# Altium project Kiki's Farm.PrjPcb
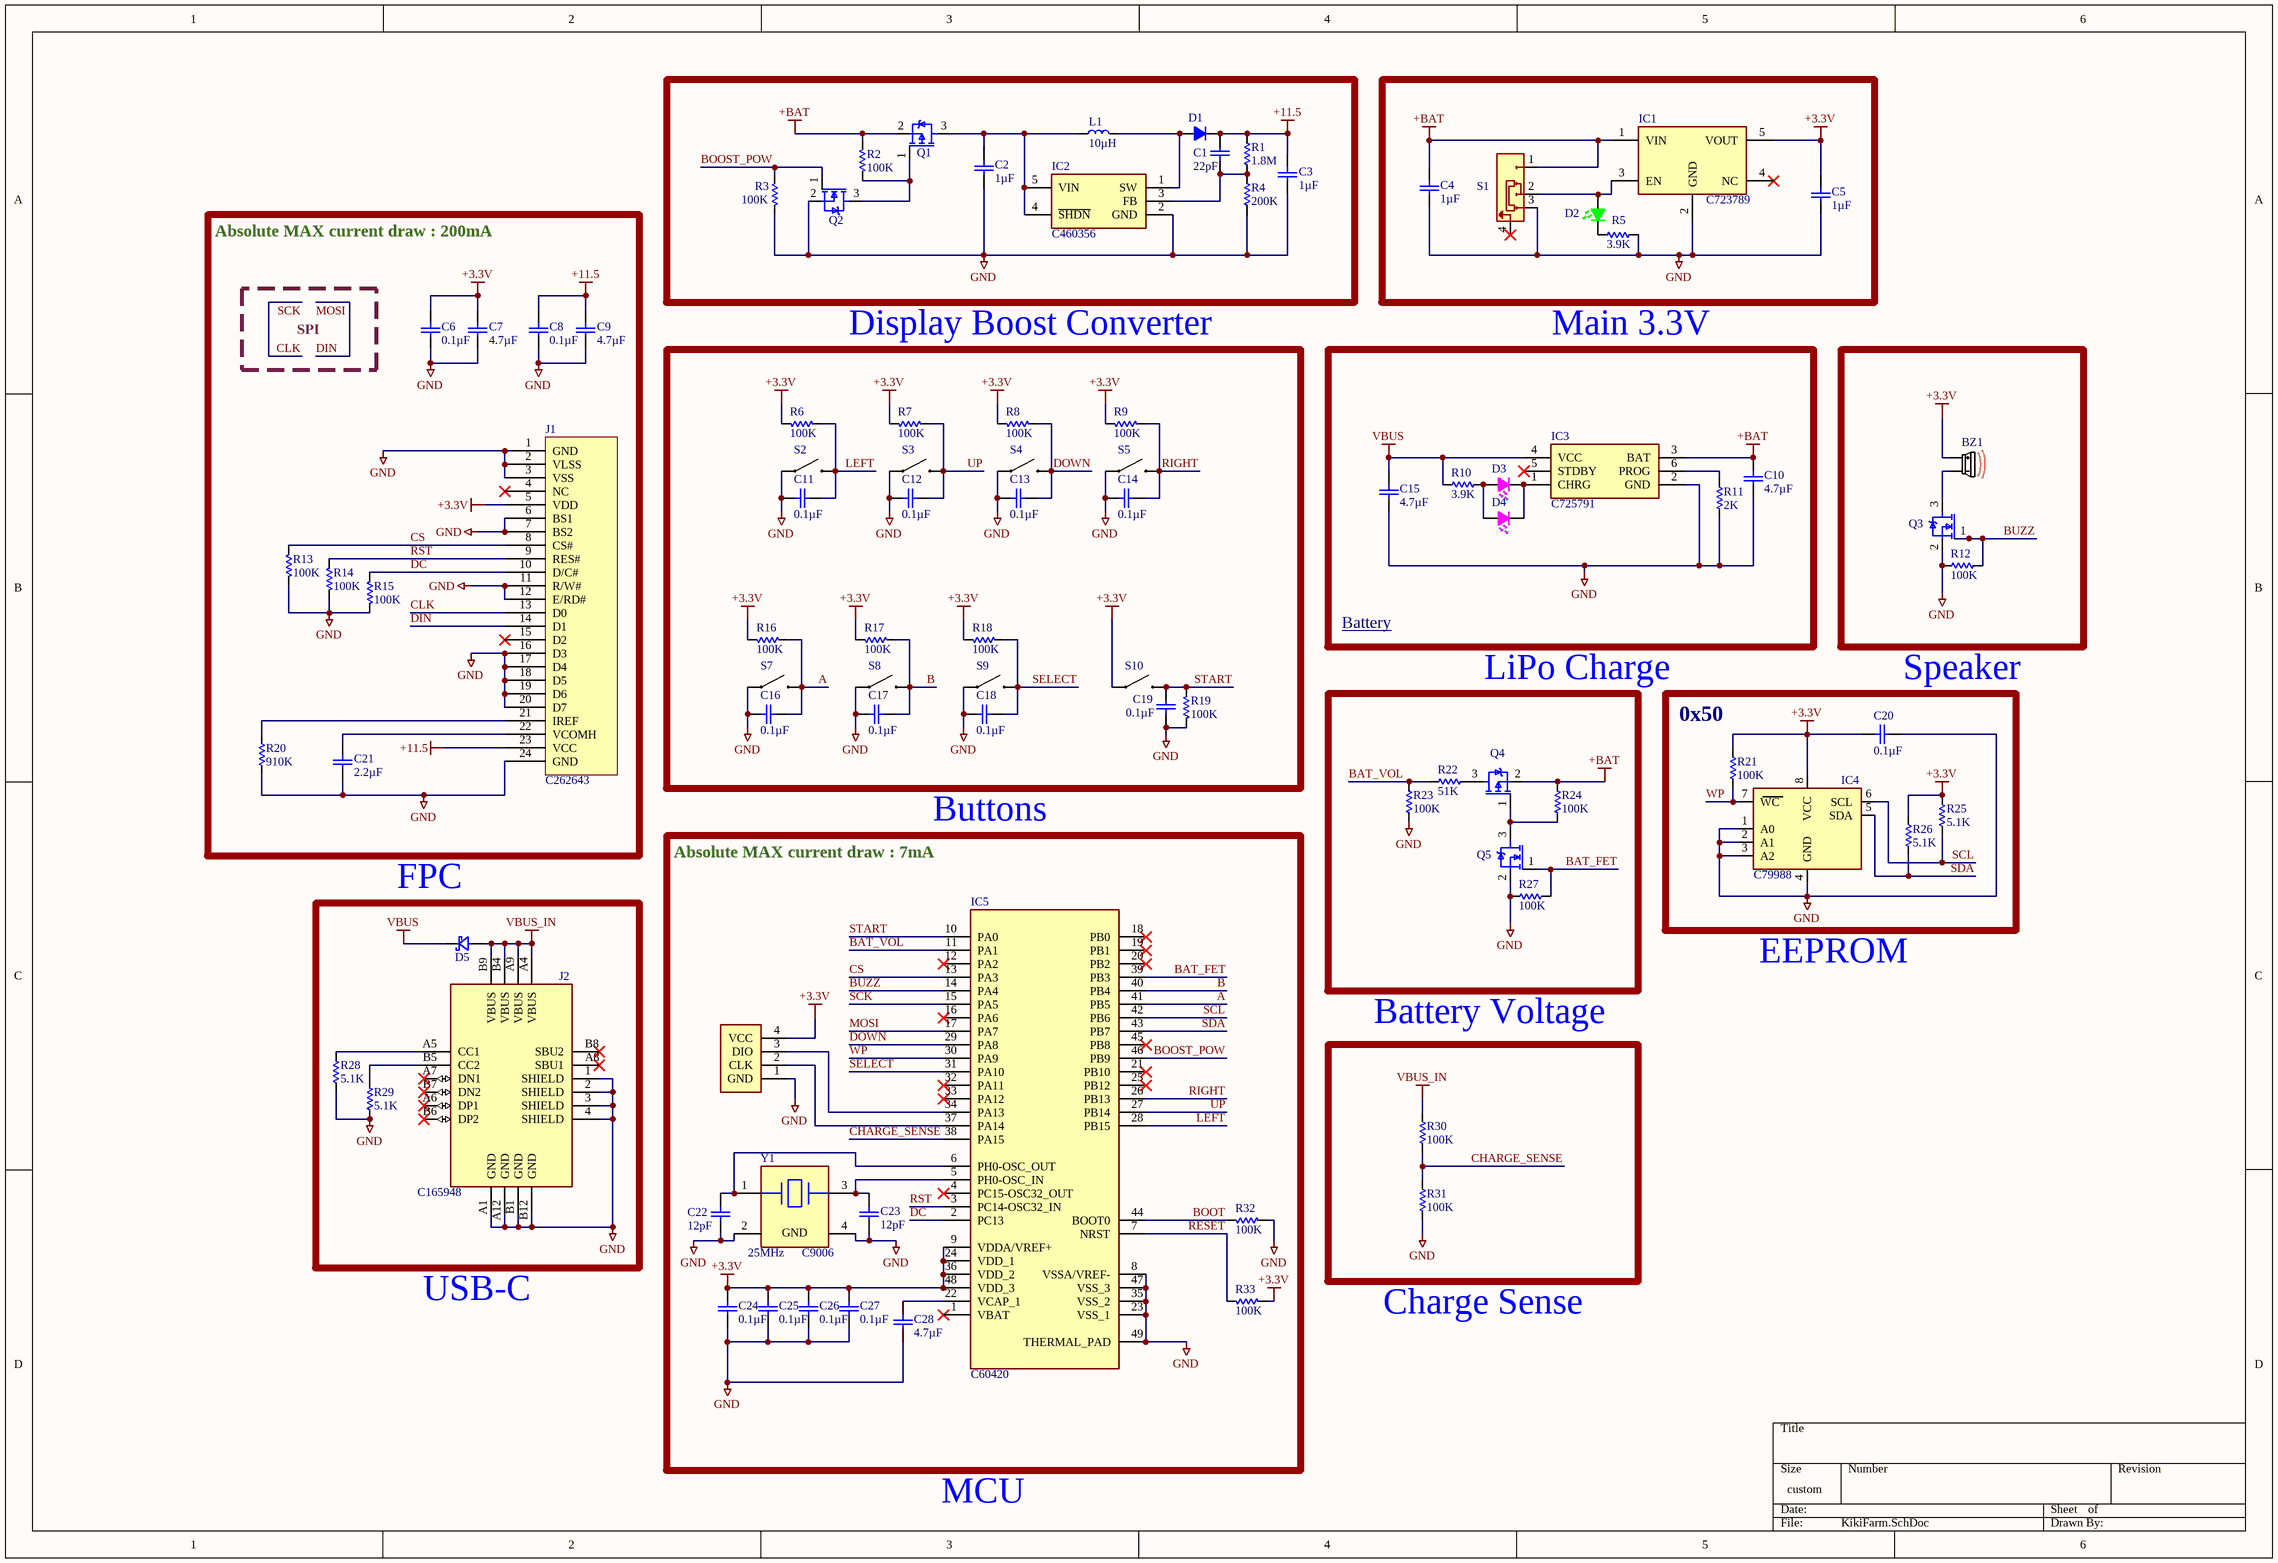
[diagram p0: KikiFarm.SchDoc]
1 sheet, 91 parts. Net scope: global (net labels, ports and power ports of the same name join across sheets).
Board file: KikiFarm.PcbDoc

## Sheet KikiFarm.SchDoc
size 426 x 292 mm; SheetNumber: 1; SheetTotal: 1

### Parts
BZ1  C94598  [MLT-5020]  (value not drawn)
C1  Capacitance: 22pF  [CAP0603]  (hidden comment: C105620)
C2  Capacitance: 1µF  [CAP0603]  (hidden comment: C59302)
C3  Capacitance: 1µF  [CAP0603]  (hidden comment: C59302)
C4  Capacitance: 1µF  [CAP0603]  (hidden comment: C59302)
C5  Capacitance: 1µF  [CAP0603]  (hidden comment: C59302)
C6  Capacitance: 0.1µF  [CAP0603]  (hidden comment: C1590)
C7  Capacitance: 4.7µF  [CAP0603]  (hidden comment: C69335)
C8  Capacitance: 0.1µF  [CAP0603]  (hidden comment: C1590)
C9  Capacitance: 4.7µF  [CAP0603]  (hidden comment: C69335)
C10  Capacitance: 4.7µF  [CAP0603]  (hidden comment: C69335)
C11  Capacitance: 0.1µF  [CAP0603]  (hidden comment: C1590)
C12  Capacitance: 0.1µF  [CAP0603]  (hidden comment: C1590)
C13  Capacitance: 0.1µF  [CAP0603]  (hidden comment: C1590)
C14  Capacitance: 0.1µF  [CAP0603]  (hidden comment: C1590)
C15  Capacitance: 4.7µF  [CAP0603]  (hidden comment: C69335)
C16  Capacitance: 0.1µF  [CAP0603]  (hidden comment: C1590)
C17  Capacitance: 0.1µF  [CAP0603]  (hidden comment: C1590)
C18  Capacitance: 0.1µF  [CAP0603]  (hidden comment: C1590)
C19  Capacitance: 0.1µF  [CAP0603]  (hidden comment: C1590)
C20  Capacitance: 0.1µF  [CAP0603]  (hidden comment: C1590)
C21  Capacitance: 2.2µF  [CAP0603]  (hidden comment: C57895)
C22  Capacitance: 12pF  [CAP0603]  (hidden comment: C38523)
C23  Capacitance: 12pF  [CAP0603]  (hidden comment: C38523)
C24  Capacitance: 0.1µF  [CAP0603]  (hidden comment: C1590)
C25  Capacitance: 0.1µF  [CAP0603]  (hidden comment: C1590)
C26  Capacitance: 0.1µF  [CAP0603]  (hidden comment: C1590)
C27  Capacitance: 0.1µF  [CAP0603]  (hidden comment: C1590)
C28  Capacitance: 4.7µF  [CAP0603]  (hidden comment: C69335)
D1  C917117  [SOD2713X115N]  (value not drawn)
D2  C7371905  [LED0603]  (value not drawn)
D3  C2977076  [LED0603]  (value not drawn)
D4  C2977076  [LED0603]  (value not drawn)
D5  C78545  [SOD-123]  (value not drawn)
IC1  C723789  [SOT-23-5]
IC2  C460356  [SOT95P282X145-5N]
IC3  C725791  [SOT-23-6]
IC4  C79988  [SOIC-8]
IC5  C60420  [QFN50P700X700X60-49N-D]
J1  C262643  [FPC24P]
J2  C165948  [TYPE-C-31-M-12]
L1  Inductance: 10µH  [DFE2HCAH1R0MJ0L]  (hidden comment: C237599)
Q1  C4748724  [SOT-23-3]  (value not drawn)
Q2  C4748714  [SOT-23-3]  (value not drawn)
Q3  C4748714  [SOT-23-3]  (value not drawn)
Q4  C4748724  [SOT-23-3]  (value not drawn)
Q5  C4748714  [SOT-23-3]  (value not drawn)
R1  Resistance: 1.8M  [RES0603]  (hidden comment: C2933162)
R2  Resistance: 100K  [RES0603]  (hidden comment: C14675)
R3  Resistance: 100K  [RES0603]  (hidden comment: C14675)
R4  Resistance: 200K  [RES0603]  (hidden comment: C105574)
R5  Resistance: 3.9K  [RES0603]  (hidden comment: C23018)
R6  Resistance: 100K  [RES0603]  (hidden comment: C14675)
R7  Resistance: 100K  [RES0603]  (hidden comment: C14675)
R8  Resistance: 100K  [RES0603]  (hidden comment: C14675)
R9  Resistance: 100K  [RES0603]  (hidden comment: C14675)
R10  Resistance: 3.9K  [RES0603]  (hidden comment: C23018)
R11  Resistance: 2K  [RES0603]  (hidden comment: C22975)
R12  Resistance: 100K  [RES0603]  (hidden comment: C14675)
R13  Resistance: 100K  [RES0603]  (hidden comment: C14675)
R14  Resistance: 100K  [RES0603]  (hidden comment: C14675)
R15  Resistance: 100K  [RES0603]  (hidden comment: C14675)
R16  Resistance: 100K  [RES0603]  (hidden comment: C14675)
R17  Resistance: 100K  [RES0603]  (hidden comment: C14675)
R18  Resistance: 100K  [RES0603]  (hidden comment: C14675)
R19  Resistance: 100K  [RES0603]  (hidden comment: C14675)
R20  Resistance: 910K  [RES0603]  (hidden comment: C2907075)
R21  Resistance: 100K  [RES0603]  (hidden comment: C14675)
R22  Resistance: 51K  [RES0603]  (hidden comment: C23196)
R23  Resistance: 100K  [RES0603]  (hidden comment: C14675)
R24  Resistance: 100K  [RES0603]  (hidden comment: C14675)
R25  Resistance: 5.1K  [RES0603]  (hidden comment: C23186)
R26  Resistance: 5.1K  [RES0603]  (hidden comment: C23186)
R27  Resistance: 100K  [RES0603]  (hidden comment: C14675)
R28  Resistance: 5.1K  [RES0603]  (hidden comment: C23186)
R29  Resistance: 5.1K  [RES0603]  (hidden comment: C23186)
R30  Resistance: 100K  [RES0603]  (hidden comment: C14675)
R31  Resistance: 100K  [RES0603]  (hidden comment: C14675)
R32  Resistance: 100K  [RES0603]  (hidden comment: C14675)
R33  Resistance: 100K  [RES0603]  (hidden comment: C14675)
S1  C431540  [MSK12C02]  (value not drawn)
S2  C720477  [TS-1088-AR02016]  (value not drawn)
S3  C720477  [TS-1088-AR02016]  (value not drawn)
S4  C720477  [TS-1088-AR02016]  (value not drawn)
S5  C720477  [TS-1088-AR02016]  (value not drawn)
S7  C720477  [TS-1088-AR02016]  (value not drawn)
S8  C720477  [TS-1088-AR02016]  (value not drawn)
S9  C720477  [TS-1088-AR02016]  (value not drawn)
S10  C720477  [TS-1088-AR02016]  (value not drawn)
SW1  SW Debug  [SW Debug]  (value not drawn)
Y1  C9006  Frequency: 25MHz  [X322525MOB4SI]

### Blocks framed on the sheet
Absolute MAX current draw : 200mA: C6-C9 C21 J1 R13-R15 R20
Battery: C10 C15 D3 D4 IC3 R10 R11
0x50: C20 IC4 R21 R25 R26
Absolute MAX current draw : 7mA: C22-C28 IC5 R32 R33 SW1 Y1

### Nets
+3.3V: BZ1.1 C5.2 C6.2 C7.2 C20.2 C24.2 C25.2 C26.2 C27.2 IC1.5(VOUT) IC4.8(VCC) IC5.9(VDDA/VREF+) IC5.24(VDD_1) IC5.36(VDD_2) IC5.48(VDD_3) J1.5(VDD) R6.1 R7.1 R8.1 R9.1 R16.1 R17.1 R18.1 R21.2 R25.2 R26.2 R33.1 S10.1 SW1.4(VCC)
+11.5: C1.1 C3.2 C8.2 C9.2 D1.1(K) J1.23(VCC) R1.2
+BAT: C4.2 C10.2 IC1.1(VIN) IC3.3(BAT) Q1.2(S) Q4.2(S) R2.2 R24.2 S1.1
GND: C2.1 C3.1 C4.1 C5.1 C6.1 C7.1 C8.1 C9.1 C10.1 C11.2 C12.2 C13.2 C14.2 C15.1 C16.2 C17.2 C18.2 C19.2 C20.1 C21.1 C22.1 C23.1 C24.1 C25.1 C26.1 C27.1 C28.1 IC1.2(GND) IC2.2(GND) IC3.2(GND) IC4.1(A0) IC4.2(A1) IC4.3(A2) IC4.4(GND) IC5.8(VSSA/VREF-) IC5.23(VSS_1) IC5.35(VSS_2) IC5.47(VSS_3) IC5.49(THERMAL_PAD) J1.1(GND) J1.2(VLSS) J1.3(VSS) J1.6(BS1) J1.7(BS2) J1.11(R/W#) J1.12(E/RD#) J1.16(D3) J1.17(D4) J1.18(D5) J1.19(D6) J1.20(D7) J1.24(GND) J2.1(SHIELD) J2.2(SHIELD) J2.3(SHIELD) J2.4(SHIELD) J2.A1(GND) J2.A12(GND) J2.B1(GND) J2.B12(GND) Q2.2(S) Q3.2(S) Q5.2(S) R3.1 R4.1 R5.2 R11.1 R12.2 R13.2 R14.2 R15.2 R19.1 R20.1 R23.2 R27.2 R28.1 R29.1 R31.1 R32.1 S1.3 S2.1 S3.1 S4.1 S5.1 S7.1 S8.1 S9.1 SW1.1(GND) Y1.2(GND) Y1.4(GND)
VBUS: C15.2 D5.1(K) IC3.4(VCC) R10.1
VBUS_IN: D5.2(A) J2.A4(VBUS) J2.A9(VBUS) J2.B4(VBUS) J2.B9(VBUS) R30.2
A: C16.1 IC5.41(PB5) R16.2 S7.2
B: C17.1 IC5.40(PB4) R17.2 S8.2
BAT_FET: IC5.39(PB3) Q5.1(G) R27.1
BAT_VOL: IC5.11(PA1) R22.2 R23.1
BOOST_POW: IC5.46(PB9) Q2.1(G) R3.2
BOOT: IC5.44(BOOT0) R32.2
BUZZ: IC5.14(PA4) Q3.1(G) R12.1
CHARGE_SENSE: IC5.38(PA15) R30.1 R31.2
CLK: IC5.15(PA5) J1.13(D0)  [also labelled SCK]
CS: IC5.13(PA3) J1.8(CS#) R13.1
DC: IC5.2(PC13) J1.10(D/C#) R15.1
DIN: IC5.17(PA7) J1.14(D1)  [also labelled MOSI]
DOWN: C13.1 IC5.29(PA8) R8.2 S4.2
LEFT: C11.1 IC5.28(PB15) R6.2 S2.2
RESET: IC5.7(NRST) R33.2
RIGHT: C14.1 IC5.26(PB13) R9.2 S5.2
RST: IC5.3(PC14-OSC32_IN) J1.9(RES#) R14.1
SCL: IC4.6(SCL) IC5.42(PB6) R25.1
SDA: IC4.5(SDA) IC5.43(PB7) R26.1
SELECT: C18.1 IC5.31(PA10) R18.2 S9.2
START: C19.1 IC5.10(PA0) R19.2 S10.2
UP: C12.1 IC5.27(PB14) R7.2 S3.2
WP: IC4.7(WC) IC5.30(PA9) R21.1
NetBZ1_2: BZ1.2 Q3.3(D)
NetC1_2: C1.2 IC2.3(FB) R1.1 R4.2
NetC2_2: C2.2 IC2.4(~{SHDN}) IC2.5(VIN) L1.1 Q1.3(D)
NetC21_2: C21.2 J1.22(VCOMH)
NetC22_2: C22.2 IC5.6(PH0-OSC_OUT) Y1.1
NetC23_2: C23.2 IC5.5(PH0-OSC_IN) Y1.3
NetC28_2: C28.2 IC5.22(VCAP_1)
NetD1_2: D1.2(A) IC2.1(SW) L1.2
NetD2_1: D2.1(K) R5.1
NetD2_2: D2.2(A) IC1.3(EN) S1.2
NetD3_1: D3.1(K) D4.1(K) IC3.1(CHRG)
NetD3_2: D3.2(A) D4.2(A) R10.2
NetIC3_6: IC3.6(PROG) R11.2
NetIC5_34: IC5.34(PA13) SW1.3(DIO)
NetIC5_37: IC5.37(PA14) SW1.2(CLK)
NetJ1_21: J1.21(IREF) R20.2
NetJ2_A5: J2.A5(CC1) R28.2
NetJ2_B5: J2.B5(CC2) R29.2
NetQ1_1: Q1.1(G) Q2.3(D) R2.1
NetQ4_1: Q4.1(G) Q5.3(D) R24.1
NetQ4_3: Q4.3(D) R22.1

Not connected (* = marked no-connect by the designer): IC1 4(NC)*; IC3 5(STDBY)*; IC5 1(VBAT)* 4(PC15-OSC32_OUT)* 12(PA2)* 16(PA6)* 18(PB0)* 19(PB1)* 20(PB2)* 21(PB10)* 25(PB12)* 32(PA11)* 33(PA12)* 45(PB8)*; J1 4(NC)* 15(D2)*; J2 A6(DP1)* A7(DN1)* A8(SBU1)* B6(DP2)* B7(DN2)* B8(SBU2)*; S1 4*

### Notes on the sheet
- SPI
- Display Boost Converter
- Main 3.3V
- LiPo Charge
- (near C20) Speaker
- Buttons
- (near D5) FPC
- EEPROM
- Battery Voltage
- USB-C
- Charge Sense
- MCU

### Library data of the parts
BZ1 = MLT-5020: LCSC Part - / Piezo Extern. Buzzer - / C94598
C1 = CC0603JRNPO9BN220: LCSC Part - / 0603 50V 22pF 5% - / C105620
C2-C5 = 0603B105K250NT: LCSC Part - / 0603 25V 1µF 10% X7R- / C59302
C6 C8 = CL10B104KA8NNNC: LCSC Part - / 0603 25V 0.1µF 10% X7R - / C1590
C7 C9 C10 C15 C28 = CL10A475KA8NQNC: LCSC Part - / 0603 25V 4.7µF 10% X5R - / C69335
C11-C14 C16-C20 C24-C27 = CL10B104KA8NNNC: LCSC Part - / 0603 25V 0.1µF 10% X7R- / C1590
C21 = CL10A225KA8NNNC: LCSC Part - / 0603 25V 2.2µF 10% X5R - / C57895
C22 C23 = CL10C120JB8NNNC: LCSC Part - / 0603 50V 12pF ±5% - / C38523
D1 = 1N4148WS: LCSC Part - / Diode 300mA 1.25V@150mA - / C917117
D2 = XL-1608PGC-06: LCSC Part - / Green LED 5mA - / C7371905
D3 D4 = XL-1608UPC-06: LCSC Part - / Pink LED 5mA - / C2977076
D5 = LMBR0540T1G: LCSC Part - / Schottky 40V 500mA - / C78545; Height: 1.35mm
IC1 = HE9073A33M5R: LCSC Part - / LDO 500mA 3.3V 100mV - / C723789
IC2 = AP3012KTR-E1: LCSC Part - / Boost 500mA 2.6V~16V - / C460356
IC3 = TP4057: LCSC Part - / 500mA Battery IC - / C725791
IC4 = M24C64-RMN6TP: LCSC Part - / EEPROM 64Kb - / C79988
IC5 = STM32F411CEU6: LCSC Part - / STM32F4 - / C60420; Manufacturer_Name: STMicroelectronics; Datasheet Link: http://www.st.com/content/ccc/resource/technical/document/datasheet/b3/a5/46/3b/b4/e5/4c/85/DM00115249.pdf/files/DM00115249.pdf/jcr:content/translations/en.DM00115249.pdf; Height: 0.6mm; Manufacturer_Part_Number: STM32F411CEU6; Mouser Part Number: 511-STM32F411CEU6; Mouser Price/Stock: https://www.mouser.co.uk/ProductDetail/STMicroelectronics/STM32F411CEU6?qs=pjMTYa9MTGV3ou31YBFa3g%3D%3D; Arrow Part Number: STM32F411CEU6; Arrow Price/Stock: https://www.arrow.com/en/products/stm32f411ceu6/stmicroelectronics?utm_currency=USD&region=nac
J1 = AFC07-S24ECA-00: LCSC Part - / 24p 0.5mm Pitch FPC - / C262643
J2 = TYPE-C-31-M-12: LCSC Part - / USB-C 3.1 - / C165948
L1 = 1239AS-H-100M=P2: LCSC Part - / 850mA 10µH Inductor +20% - / C237599
Q1 Q4 = AO3401-ED: LCSC Part - / SOT-23 P-CH 20V 3A - / C4748724
Q2 Q3 Q5 = SI2302-HXY: LCSC Part - / SOT-23 N-CH 20V 2.8A - / C4748714
R1 = FRC0603F1804TS: LCSC Part - / 0603 1.8M 1% - / C2933162
R2 R3 R6-R9 R12-R19 R21 R23 R24 R27 R30-R33 = RC0603FR-07100KL: LCSC Part - / 0603 100K 1% - / C14675
R4 = RC0603FR-07200KL: LCSC Part - / 0603 200K 1% - / C105574
R5 R10 = 0603WAF3901T5E: LCSC Part - / 0603 3.9K 1% - / C22843
R11 = 0603WAF2001T5E: LCSC Part - / 0603 2K 1% - / C22975
R20 = FRC0603F9103TS: LCSC Part - / 0603 910K 1% - / C2907075
R22 = 0603WAF5102T5E: LCSC Part - / 0603 51K 1% - / C23196
R25 R26 R28 R29 = 0603WAF5101T5E: LCSC Part - / 0603 5.1K 1% - / C23186
S1 = MSK12C02: LCSC Part - / Slide Switch 50mA - / C431540
S2-S5 S7-S10 = TS-1088-AR02016: LCSC Part - / Tactile Switch 3mm x 2mm - / C720477
Y1 = X322525MOB4SI: LCSC Part - / 25MHz 12pF Crystal - / C9006

## Assembly variants
V01: not fitted R1 R8 R9 R9